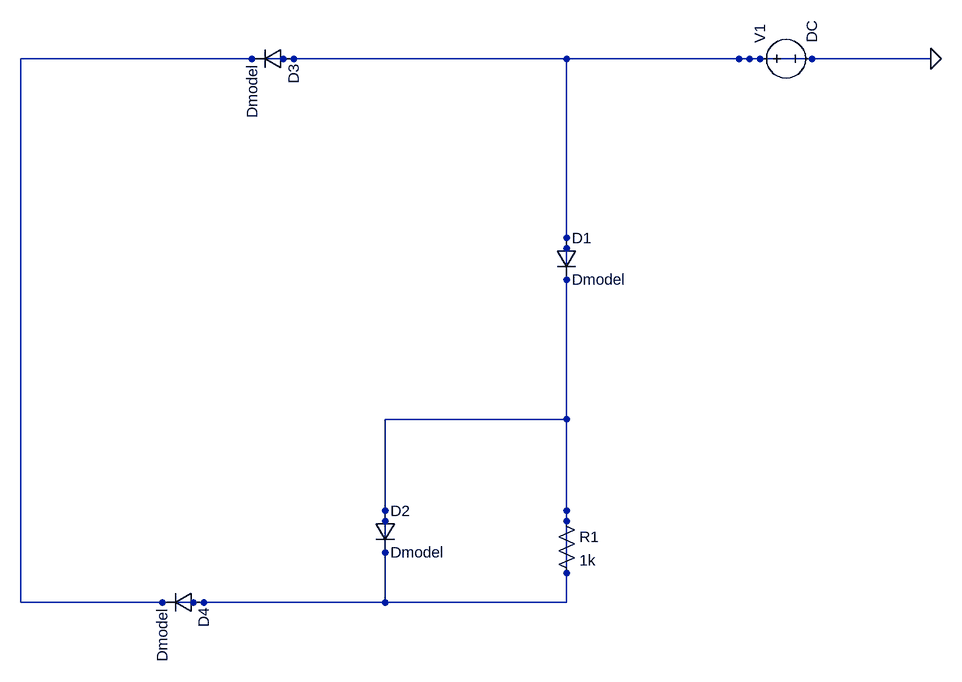
[diagram p0: schematic netlist6.asc]
netlist6.asc, the LTspice schematic file:
Version 4
SHEET 1 680 480
SYMBOL voltage 1380 255 R270
SYMATTR InstName V1
SYMATTR Value DC
FLAG 1659 255 0
SYMBOL diode 1082 531 R0
SYMATTR InstName D1
SYMATTR Value Dmodel
SYMBOL diode 803 951 R0
SYMATTR InstName D2
SYMATTR Value Dmodel
SYMBOL diode 678 239 R90
SYMATTR InstName D3
SYMATTR Value Dmodel
SYMBOL diode 540 1076 R90
SYMATTR InstName D4
SYMATTR Value Dmodel
SYMBOL res 1082 951 R0
SYMATTR InstName R1
SYMATTR Value 1k
WIRE 1098 255 1380 255
WIRE 1659 255 1364 255
WIRE 1098 547 1098 255
WIRE 1098 810 1098 531
WIRE 819 1092 819 951
WIRE 662 255 1098 255
WIRE 524 1092 819 1092
WIRE 540 1092 258 1092
WIRE 1098 967 1098 810
WIRE 819 810 1098 810
WIRE 819 810 819 967
WIRE 258 255 678 255
WIRE 258 255 258 1092
WIRE 1098 1092 819 1092
WIRE 1098 1092 1098 951

The netlist it stands for:
* netlist6.asc
V1 0 0 DC
D1 0 0 Dmodel
D2 0 0 Dmodel
D3 0 0 Dmodel
D4 0 0 Dmodel
R1 0 0 1k
.model D D
.lib standard.dio
.backanno
.end